# Altium schematic sheet Current_Sense.SchDoc
size A4; SheetNumber: 4; SheetTotal: 7
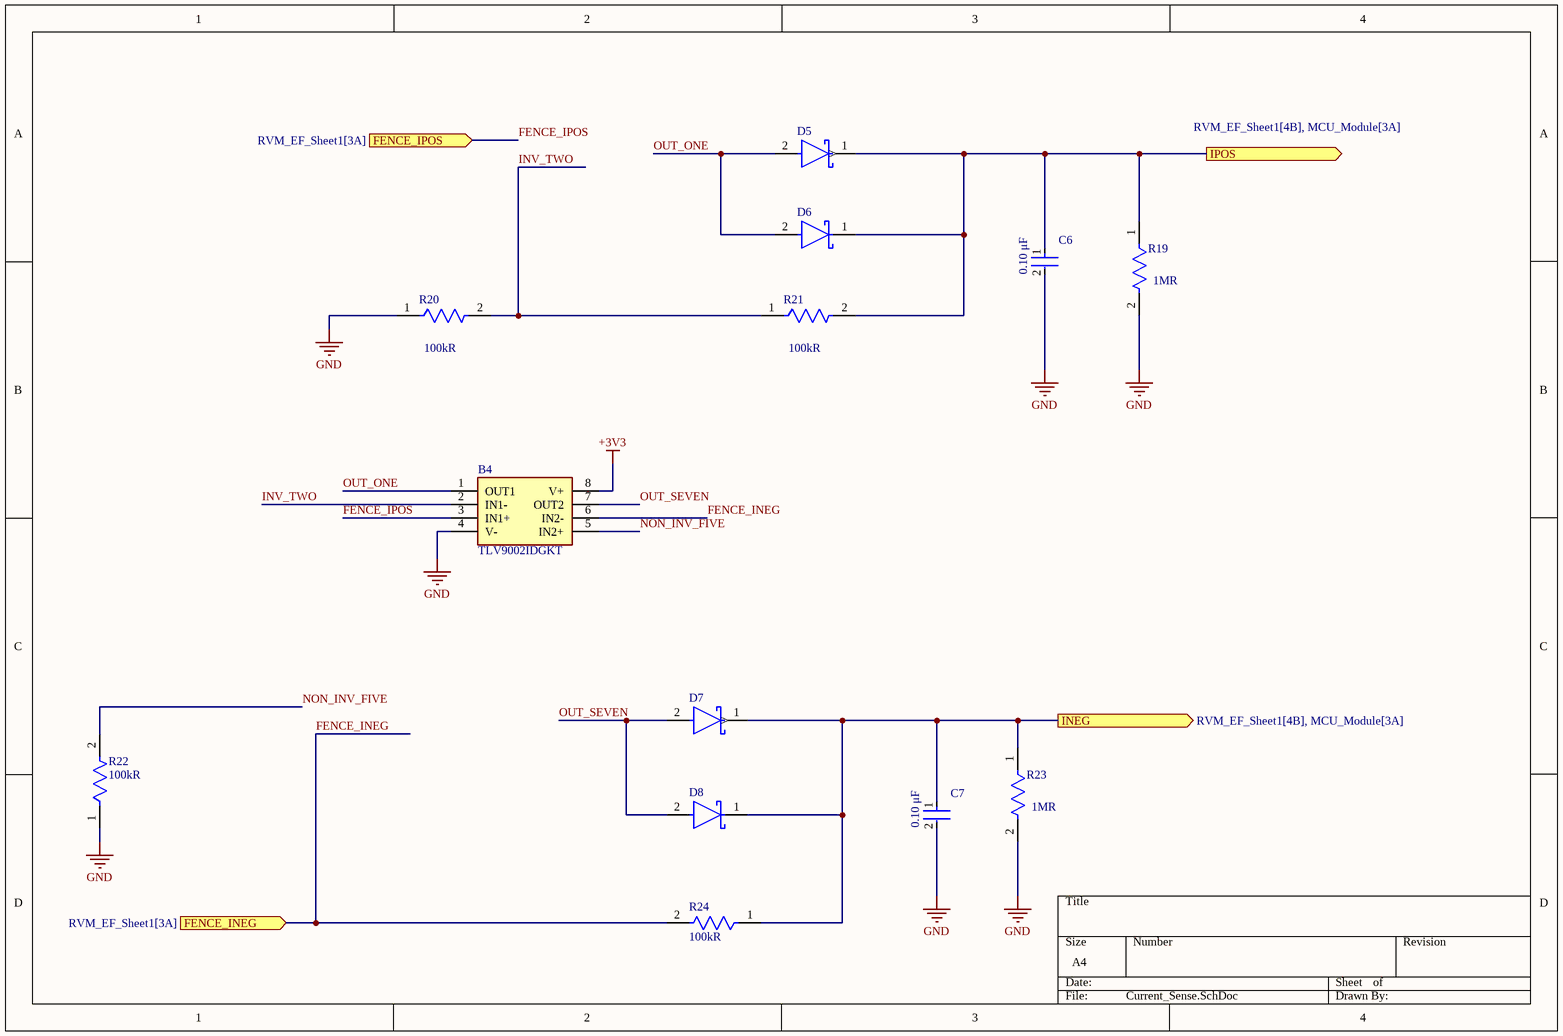
[diagram p0: Current_Sense.SchDoc]

## Parts
B4  TLV9002IDGKT  [SOIC127P610X140-8M]
C6  value 0.10 μF  [FP-C1206C-EB-MFG]  (hidden comment: C1206C104F3GACTU)
C7  value 0.10 μF  [FP-C1206C-EB-MFG]  (hidden comment: C1206C104F3GACTU)
D5  PMEG3010BER,115  [FP-SOD123W-MFG]  (value not drawn)
D6  PMEG3010BER,115  [FP-SOD123W-MFG]  (value not drawn)
D7  PMEG3010BER,115  [FP-SOD123W-MFG]  (value not drawn)
D8  PMEG3010BER,115  [FP-SOD123W-MFG]  (value not drawn)
R19  Resistance: 1MR  [FP-RMCF0805-IPC_A]  (hidden comment: RMCF0805FT1M00)
R20  Resistance: 100kR  [FP-MCU0805-IPC_B]  (hidden comment: MCU08050D1003BP500)
R21  Resistance: 100kR  [FP-MCU0805-IPC_B]  (hidden comment: MCU08050D1003BP500)
R22  Resistance: 100kR  [FP-MCU0805-IPC_B]  (hidden comment: MCU08050D1003BP500)
R23  Resistance: 1MR  [FP-RMCF0805-IPC_A]  (hidden comment: RMCF0805FT1M00)
R24  Resistance: 100kR  [FP-MCU0805-IPC_B]  (hidden comment: MCU08050D1003BP500)

## Ports
FENCE_INEG (in, see RVM_EF_Sheet1[3A]), FENCE_IPOS (in, see RVM_EF_Sheet1[3A]), INEG (out, see RVM_EF_Sheet1[4B], MCU_Module[3A]), IPOS (out, see RVM_EF_Sheet1[4B], MCU_Module[3A])

## Nets
+3V3: B4.8(V+)
GND: B4.4(V-) C6.2 C7.2 R19.2 R20.1 R22.1 R23.2
FENCE_INEG: B4.6(IN2-) R24.2 ; port FENCE_INEG
FENCE_IPOS: B4.3(IN1+) ; port FENCE_IPOS
INEG: C7.1 D7.1(K) D8.1(K) R23.1 R24.1 ; port INEG
INV_TWO: B4.2(IN1-) R20.2 R21.1
IPOS: C6.1 D5.1(K) D6.1(K) R19.1 R21.2 ; port IPOS
NON_INV_FIVE: B4.5(IN2+) R22.2
OUT_ONE: B4.1(OUT1) D5.2(A) D6.2(A)
OUT_SEVEN: B4.7(OUT2) D7.2(A) D8.2(A)

## Library data of the parts
B4 = TLV9002IDGKT: 2-Channel, 1MHz, RRIO, 1.8V to 5.5V Operational Amplifier for Cost-Optimized Systems; Manufacturer_Name: Texas Instruments; Geometry.Height: 1.1mm; Mouser Part Number: 595-TLV9002IDGKT; Mouser Price/Stock: https://www.mouser.co.uk/ProductDetail/Texas-Instruments/TLV9002IDGKT?qs=wUXugUrL1qxkc8vIM2YvZQ%3D%3D; Manufacturer_Part_Number: TLV9002IDGKT; Datasheet Link: https://www.ti.com/lit/ds/symlink/tlv9002.pdf?ts=1635497933449
C6 C7 = CMP-1037-04186-2: CAP CER 0.1UF 25V C0G/NP0 1206; Manufacturer: KEMET; Material: Ceramic; Temperature Characteristic: C0G; Temperature Coefficient: 15%; Tolerance: 0.01; Automotive Grade: Grade 0; Device Class L3: Ceramic Capacitors; Voltage Rating: 25 V; Temperature Range Low: -55°C; RoHS: TRUE; Package: C1206C-EB; Category: Cap; Lead Free: Yes; Manufacturer Part Number: C1206C104F3GACTU; ComponentLink2URL: https://content.kemet.com/datasheets/KEM_C1007_X8R_ULTRA_150C_SMD.pdf; Ipc Land Pattern Name: CAPC320160X78; Temperature Range High: +150°C; Height: 0.88mm; Digikey Description: CAP CER 0.1UF 25V C0G/NP0 1206; ComponentLink2Description: Datasheet; Capacitance: 0.10 μF; Mouser Description: Multilayer Ceramic Capacitors MLCC - SMD/SMT 25volts 0.1uF 1% C0G; Octopart: https://octopart.com/c1206c104f3gactu-kemet-13149870; Device Class L1: Passive Components; Device Class L2: Capacitors; Automotive: Yes; Temperature: -55°C to +150°C
D5-D8 = CMP-14398-000004-1: DIODE SCHOTTKY 30V 1A SOD123W; Manufacturer: Nexperia; Automotive Grade: Grade 0; Max Surge Forward Current: 50A; Peak Reverse Current: 15uA; Max Junction Temp: +150°C; Capacitance: 170pF; Value: 170pF; ComponentLink2URL: https://assets.nexperia.com/documents/data-sheet/PMEG3010BER.pdf; Reverse Voltage: 30V; Forward Current: 1A; Ambient Temperature Range Low: -55°C; Ambient Temperature Range High: +150°C; Octopart: https://octopart.com/pmeg3010ber%2C115-nexperia-78741454; Package: SOD123W; Category: Diode; Lead Free: Yes; Digikey Description: DIODE SCHOTTKY 30V 1A SOD123W; Automotive: Yes; RoHS: TRUE; Height: 1.1mm; Temperature: to +150°C; Device Class L2: Diodes; ComponentLink2Description: Datasheet; Manufacturer Part Number: PMEG3010BER,115; Temperature Range High: +150°C; Device Class L3: Schottky Diodes; Device Class L1: Discrete Semiconductors; Footprint Url: https://assets.nexperia.com/documents/outline-drawing/SOD123W.pdf
R19 R23 = CMP-26527-007472-1: 1MΩ ±1% 0.125W 0805 Thick Film Chip Resistor AEC-Q200 compliant; Max Power Dissipation: 125mW; Temperature Coefficient: 100ppm/°C; Lead Free: Lead Free; Depth: 1.25mm; Power Rating: 125mW; Mount: Surface Mount; Length: 2mm; Max Operating Temperature: 155°C; Packaging: Tape and Reel; Size Code: 0805; Contact Plating: Tin; Min Operating Temperature: -55°C; Resistor Type: Thick Film; Height: 0.026inch; Military Standard: Not; Features: Automotive AEC-Q200; Radiation Hardening: No; Case Code (Metric): 2012; Tolerance: 1%; Construction: Rectangular; RoHS Compliant: Yes; Number of Terminations: 2; Width: 0.049inch; Case Code (Imperial): 0805; Case/Package: 0805; Series: RMCF
R20-R22 R24 = CMP-02407-000489-1: RES 1.05K OHM 0.5% 1/5W 0805; Tolerance: 0.1%; Voltage Rating: 150V; Temperature Coefficient: 25ppm/°C; Power Rating: 125mW; REACH SVHC: No SVHC; Radiation Hardening: No; Composition: Thin Film; Contact Plating: Tin; Lead Free: Lead Free; Max Operating Temperature: 125°C; Width: 1.25mm; Case/Package: 0805; Depth: 1.25mm; Packaging: Tape and Reel; Case Code (Imperial): 0805; Length: 2mm; Case Code (Metric): 2012; Min Operating Temperature: -55°C; Voltage Rating (DC): 150V; Military Standard: Not